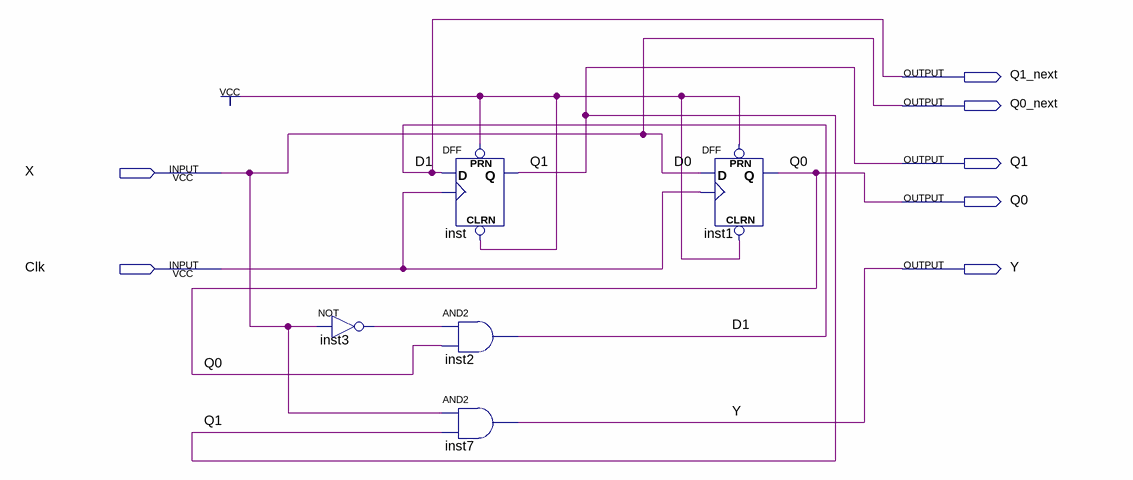
[diagram p0: schematic sheet]
// Quartus schematic mealy_fsm.bdf as structural Verilog: 5 symbols, 7 pins
module mealy_fsm (
  input  X,
  input  Clk,
  output Q1_next,
  output Q0_next,
  output Q1,
  output Q0,
  output Y
);

  wire inst3_out;

  not inst3 (inst3_out, X);
  DFF inst (.CLRN(1'b1), .CLK(Clk), .D(Q1_next), .PRN(1'b1), .Q(Q1));
  and inst2 (Q1_next, inst3_out, Q0);
  and inst7 (Y, X, Q1);
  DFF inst1 (.CLRN(1'b1), .CLK(Clk), .D(X), .PRN(1'b1), .Q(Q0));

  assign Q0_next = X;

  // Other names for the same wires on the sheet: D1 = Q1_next; D0 = X
endmodule
